# Altium schematic sheet UWB-Sheet.SchDoc
size A4; SheetNumber: 5; SheetTotal: 7
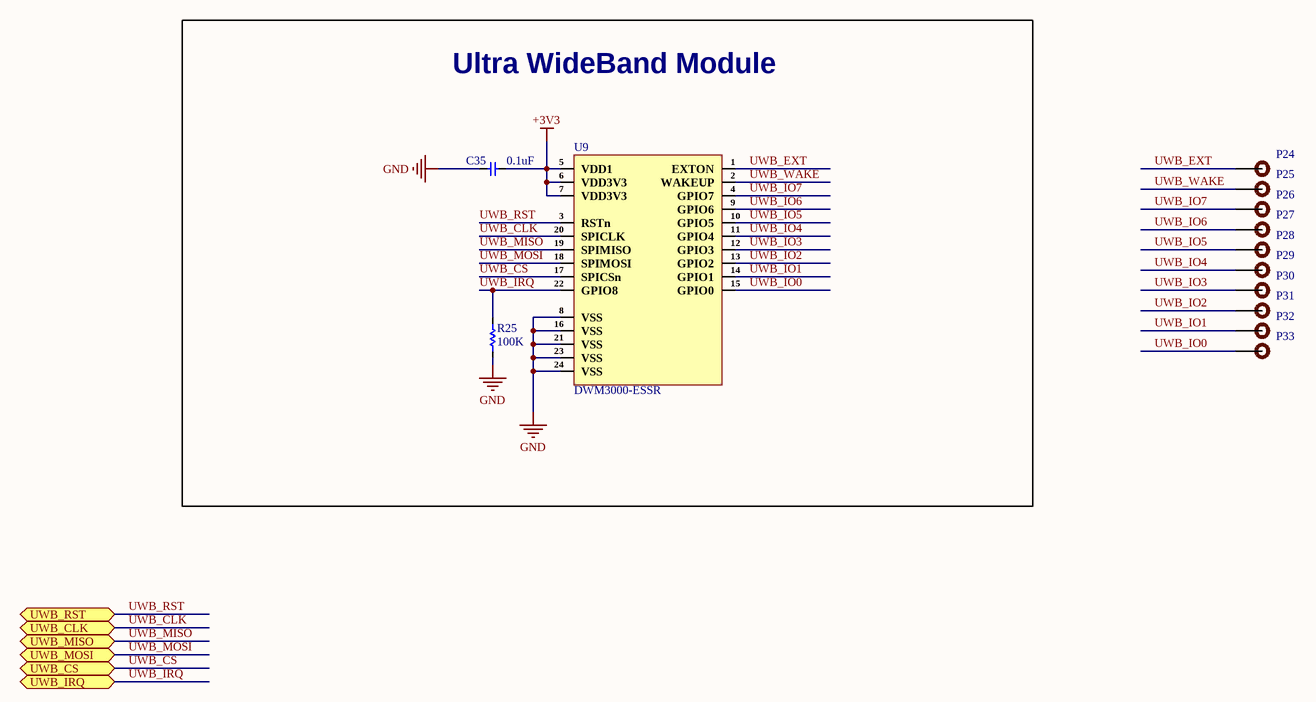
[diagram p0: UWB-Sheet.SchDoc]

## Parts
C35  0.1uF  [Cap-0603]
P24  TEST POINT  [Test-point]  (value not drawn)
P25  TEST POINT  [Test-point]  (value not drawn)
P26  TEST POINT  [Test-point]  (value not drawn)
P27  TEST POINT  [Test-point]  (value not drawn)
P28  TEST POINT  [Test-point]  (value not drawn)
P29  TEST POINT  [Test-point]  (value not drawn)
P30  TEST POINT  [Test-point]  (value not drawn)
P31  TEST POINT  [Test-point]  (value not drawn)
P32  TEST POINT  [Test-point]  (value not drawn)
P33  TEST POINT  [Test-point]  (value not drawn)
R25  100K  [Res-0603]
U9  DWM3000-ESSR  [DWM3000_ESSR]

## Blocks framed on the sheet
Ultra WideBand Module: C35 R25 U9

## Ports
UWB_CLK (bidir, see Top-Sheet[3C]), UWB_CS (bidir, see Top-Sheet[3C]), UWB_IRQ (bidir, see Top-Sheet[3C]), UWB_MISO (bidir, see Top-Sheet[3C]), UWB_MOSI (bidir, see Top-Sheet[3C]), UWB_RST (bidir, see Top-Sheet[3C])

## Nets
+3V3: C35.1 U9.5(VDD1) U9.6(VDD3V3) U9.7(VDD3V3)
GND: C35.2 R25.1 U9.8(VSS) U9.16(VSS) U9.21(VSS) U9.23(VSS) U9.24(VSS)
UWB_CLK: U9.20(SPICLK) ; port UWB_CLK
UWB_CS: U9.17(SPICSn) ; port UWB_CS
UWB_EXT: P24.1 U9.1(EXTON)
UWB_IO0: P33.1 U9.15(GPIO0)
UWB_IO1: P32.1 U9.14(GPIO1)
UWB_IO2: P31.1 U9.13(GPIO2)
UWB_IO3: P30.1 U9.12(GPIO3)
UWB_IO4: P29.1 U9.11(GPIO4)
UWB_IO5: P28.1 U9.10(GPIO5)
UWB_IO6: P27.1 U9.9(GPIO6)
UWB_IO7: P26.1 U9.4(GPIO7)
UWB_IRQ: R25.2 U9.22(GPIO8) ; port UWB_IRQ
UWB_MISO: U9.19(SPIMISO) ; port UWB_MISO
UWB_MOSI: U9.18(SPIMOSI) ; port UWB_MOSI
UWB_RST: U9.3(RSTn) ; port UWB_RST
UWB_WAKE: P25.1 U9.2(WAKEUP)

## Notes on the sheet
- File:
- Title:
- Date:
- Page
- Num:
- Total:
- Drawn By: Huzaifa Ali

## Library data of the parts
C35 = CC0603KRX7R0BB104: CAP CER 0.1UF 100V X7R 0603; Manufacturer: Yageo; Capacitance: 100nF; Tolerance: 10%; Item Type: Capacitor; Supplier 1: Digi-Key; Manufacturer Part Number: CC0603KRX7R0BB104; RoHS: Yes; Category: Ceramic Capacitors; Stock 1: 60476; Pricing 1: 1=0.19000, 10=0.13500, 50=0.07680, 100=0.06370, 500=0.04466, 1000=0.03696 (USD); Mount: Surface Mount; Case/Package: 0603; Case Code (Metric): 1608; Case Code (Imperial): 0603; Weight: 7.1E-05oz; Min Operating Temperature: -55°C; Max Operating Temperature: 125°C; Package Quantity: 4000; Voltage Rating: 100V; Packaging: Tape and Reel; Dielectric: X7R; Termination: SMD/SMT; Resistor Type: Ceramic; Voltage Rating (DC): 100V; Series: CC; Length: 0.063inch; Width: 0.031inch; Thickness: 0.035inch; Depth: 0.8mm; Lead Free: Lead Free; RoHS Compliant: Yes; ComponentLink1URL: https://datasheet.ciiva.com/6277/mlccorderingcode-6277030.pdf?src-supplier=Digi-Key; ComponentLink1Description: https://datasheet.ciiva.com/6277/mlccorderingcode-6277030.pdf?src-supplier=Digi-Key; ComponentLink2URL: https://datasheet.ciiva.com/6277/mlccorderingcode-6277081.pdf?src-supplier=Digi-Key; ComponentLink2Description: https://datasheet.ciiva.com/6277/mlccorderingcode-6277081.pdf?src-supplier=Digi-Key; ComponentLink3URL: https://datasheet.ciiva.com/6277/mlccorderingcode-6277082.pdf?src-supplier=Digi-Key; ComponentLink3Description: https://datasheet.ciiva.com/6277/mlccorderingcode-6277082.pdf?src-supplier=Digi-Key; Supplier Part Number 1: 311-1523-1-ND; LCSC Part Number: C113803
P24-P33 = TEST POINT: Test Point ON; Item Type: TEST POINT
R25 = RC0603JR-07100KL: RES 100K OHM 5% 1/10W 0603; Manufacturer: Yageo; Resistance: 100kR; Temperature Coefficient: 100ppm/°C; Voltage Rating: 50V; Power Rating: 100mW; Item Type: Resistor; Supplier 1: Digi-Key; Manufacturer Part Number: RC0603JR-07100KL; RoHS: Yes; Category: Chip SMD Resistors; Stock 1: 1210037; Pricing 1: 1=0.10000, 10=0.02000, 100=0.00800, 1000=0.00360, 2500=0.00312 (USD); Case/Package: 0603; Number of Pins: 2; Contact Plating: Tin,Matte; Case Code (Imperial): 0603; Case Code (Metric): 1608; Size Code: 0603; Min Operating Temperature: -55°C; Max Operating Temperature: 155°C; Tolerance: 5%; Resistor Type: Thick Film; Packaging: Tape and Reel; Voltage Rating (DC): 50V; Termination: SMD/SMT; Features: Moisture Resistant; Series: RC; Max Power Dissipation: 100mW; Number of Terminations: 2; Resistance Tolerance: 5%; Width: 0.8mm; Radiation Hardening: No; REACH SVHC: No SVHC; Lead Free: Lead Free; RoHS Compliant: Yes; ComponentLink1URL: https://datasheet.ciiva.com/7746/443971-7746424.pdf?src-supplier=Element14; ComponentLink1Description: https://datasheet.ciiva.com/7746/443971-7746424.pdf?src-supplier=Element14; ComponentLink2URL: https://datasheet.ciiva.com/7983/443971-7983686.pdf?src-supplier=Element14; ComponentLink2Description: https://datasheet.ciiva.com/7983/443971-7983686.pdf?src-supplier=Element14; ComponentLink3URL: https://datasheet.ciiva.com/7746/443971-7746423.pdf?src-supplier=Element14; ComponentLink3Description: https://datasheet.ciiva.com/7746/443971-7746423.pdf?src-supplier=Element14; ComponentLink4URL: https://datasheet.ciiva.com/8887/pyu-rc0603-51-rohs-l-4-8887903.pdf?src-supplier=Avnet; ComponentLink4Description: https://datasheet.ciiva.com/8887/pyu-rc0603-51-rohs-l-4-8887903.pdf?src-supplier=Avnet; Supplier Part Number 1: 311-100KGRCT-ND; LCSC Part Number: C100048
U9 = DWM3000-ESSR: RF Modules ENGINEERING SAMPLE; Manufacturer: Qorvo; Item Type: Module; Supplier 1: Mouser; Manufacturer Part Number: DWM3000-ESSR; Stock 1: 282; Pricing 1: 1=24, 10=24, 25=19.44, 50=19.44, 100=14.9, 1000=14.9, 10000=14.9 (USD); Supplier Part Number 1: 772-DWM3000-ESSR; ComponentLink1Description: LCSC; ComponentLink1URL: https://eu.mouser.com/ProductDetail/Qorvo/DWM3000-ESSR?qs=DPoM0jnrROUKQ7mLMYYEbQ%3D%3D